# Altium project 1712.PrjPCB
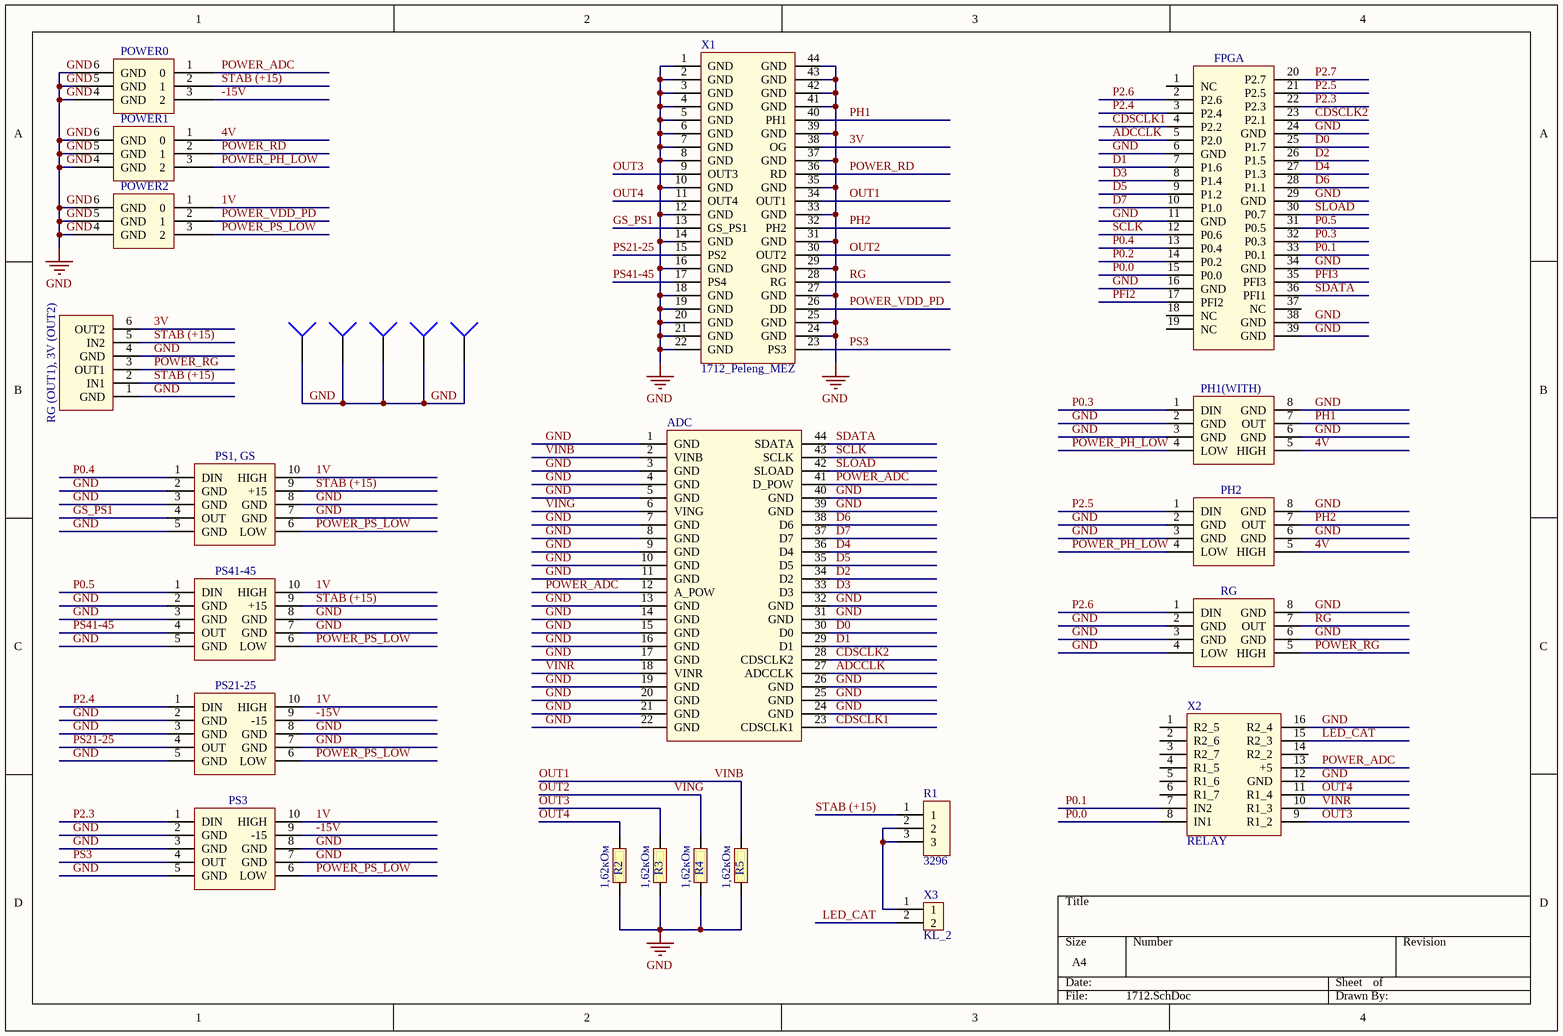
[diagram p0: 1712.SchDoc]
1 sheet, 26 parts. Net scope: global (net labels, ports and power ports of the same name join across sheets).
Board file: 1712_MB.PcbDoc

## Sheet 1712.SchDoc
size A4

### Parts
ADC  MEZON_ADC  [MEZON_ADC]  (value not drawn)
FPGA  CHEAP_CON_37_FEMALE  [CHEAP_CONN_FEMALE]  (value not drawn)
J1  Socket  [PIN1]  (value not drawn)
J2  Socket  [PIN1]  (value not drawn)
J3  Socket  [PIN1]  (value not drawn)
J4  Socket  [PIN1]  (value not drawn)
J5  Socket  [PIN1]  (value not drawn)
PH1(WITH)  MEZON_H  [MEZON_H]  (value not drawn)
PH2  MEZON_H  [MEZON_H]  (value not drawn)
POWER0  POWER  [POWER]  (value not drawn)
POWER1  POWER  [POWER]  (value not drawn)
POWER2  POWER  [POWER]  (value not drawn)
PS1,_GS  MEZON_V+15  [MEZON_V]  (value not drawn)
PS3  MEZON_V  [MEZON_V]  (value not drawn)
PS21-25  MEZON_V  [MEZON_V]  (value not drawn)
PS41-45  MEZON_V+15  [MEZON_V]  (value not drawn)
R1  3296  [PODSTR_RES_3296]
R2  1,62кОм  [RES]
R3  1,62кОм  [RES]
R4  1,62кОм  [RES]
R5  1,62кОм  [RES]
RG  MEZON_H  [MEZON_H]  (value not drawn)
RG_(OUT1),_3V_(OUT2)  MEZ_POWER  [MEZON_POWER_NEW]  (value not drawn)
X1  1712_Peleng_MEZ  [1712_Peleng_MEZ]
X2  RELAY  [RELAY_MODULE]
X3  KL_2  [KLEMMNIK_2]

### Nets
GND: ADC.1(GND) ADC.3(GND) ADC.4(GND) ADC.5(GND) ADC.7(GND) ADC.8(GND) ADC.9(GND) ADC.10(GND) ADC.11(GND) ADC.13(GND) ADC.14(GND) ADC.15(GND) ADC.16(GND) ADC.17(GND) ADC.19(GND) ADC.20(GND) ADC.21(GND) ADC.22(GND) ADC.24(GND) ADC.25(GND) ADC.26(GND) ADC.31(GND) ADC.32(GND) ADC.39(GND) ADC.40(GND) FPGA.6(GND) FPGA.11(GND) FPGA.16(GND) FPGA.24(GND) FPGA.29(GND) FPGA.34(GND) FPGA.38(GND) FPGA.39(GND) J1.1 J2.1 J3.1 J4.1 J5.1 PH1(WITH).2(GND) PH1(WITH).3(GND) PH1(WITH).6(GND) PH1(WITH).8(GND) PH2.2(GND) PH2.3(GND) PH2.6(GND) PH2.8(GND) POWER0.4(GND) POWER0.5(GND) POWER0.6(GND) POWER1.4(GND) POWER1.5(GND) POWER1.6(GND) POWER2.4(GND) POWER2.5(GND) POWER2.6(GND) PS1,_GS.2(GND) PS1,_GS.3(GND) PS1,_GS.5(GND) PS1,_GS.7(GND) PS1,_GS.8(GND) PS3.2(GND) PS3.3(GND) PS3.5(GND) PS3.7(GND) PS3.8(GND) PS21-25.2(GND) PS21-25.3(GND) PS21-25.5(GND) PS21-25.7(GND) PS21-25.8(GND) PS41-45.2(GND) PS41-45.3(GND) PS41-45.5(GND) PS41-45.7(GND) PS41-45.8(GND) R2.1 R3.1 R4.1 R5.1 RG.2(GND) RG.3(GND) RG.4(LOW) RG.6(GND) RG.8(GND) RG_(OUT1),_3V_(OUT2).1(GND) RG_(OUT1),_3V_(OUT2).4(GND) X1.1(GND) X1.2(GND) X1.3(GND) X1.4(GND) X1.5(GND) X1.6(GND) X1.7(GND) X1.8(GND) X1.10(GND) X1.12(GND) X1.14(GND) X1.16(GND) X1.18(GND) X1.19(GND) X1.20(GND) X1.21(GND) X1.22(GND) X1.24(GND) X1.25(GND) X1.27(GND) X1.29(GND) X1.31(GND) X1.33(GND) X1.35(GND) X1.37(GND) X1.39(GND) X1.41(GND) X1.42(GND) X1.43(GND) X1.44(GND) X2.12(GND) X2.16(R2_4)
1V: POWER2.1(0) PS1,_GS.10(HIGH) PS3.10(HIGH) PS21-25.10(HIGH) PS41-45.10(HIGH)
3V: RG_(OUT1),_3V_(OUT2).6(OUT2) X1.38(OG)
4V: PH1(WITH).5(HIGH) PH2.5(HIGH) POWER1.1(0)
-15V: POWER0.3(2) PS3.9(-15) PS21-25.9(-15)
ADCCLK: ADC.27(ADCCLK) FPGA.5(P2.0)
CDSCLK1: ADC.23(CDSCLK1) FPGA.4(P2.2)
CDSCLK2: ADC.28(CDSCLK2) FPGA.23(P2.1)
D0: ADC.30(D0) FPGA.25(P1.7)
D1: ADC.29(D1) FPGA.7(P1.6)
D2: ADC.34(D2) FPGA.26(P1.5)
D3: ADC.33(D3) FPGA.8(P1.4)
D4: ADC.36(D4) FPGA.27(P1.3)
D5: ADC.35(D5) FPGA.9(P1.2)
D6: ADC.38(D6) FPGA.28(P1.1)
D7: ADC.37(D7) FPGA.10(P1.0)
GS_PS1: PS1,_GS.4(OUT) X1.13(GS_PS1)
LED_CAT: X2.15(R2_3) X3.2
OUT1: ADC.2(VINB) R5.2 X1.34(OUT1)  [also labelled VINB]
OUT2: ADC.6(VING) R4.2 X1.30(OUT2)  [also labelled VING]
OUT3: R3.2 X1.9(OUT3) X2.9(R1_2)
OUT4: R2.2 X1.11(OUT4) X2.11(R1_4)
P0.0: FPGA.15(P0.0) X2.8(IN1)
P0.1: FPGA.33(P0.1) X2.7(IN2)
P0.2: FPGA.14(P0.2)
P0.3: FPGA.32(P0.3) PH1(WITH).1(DIN)
P0.4: FPGA.13(P0.4) PS1,_GS.1(DIN)
P0.5: FPGA.31(P0.5) PS41-45.1(DIN)
P2.3: FPGA.22(P2.3) PS3.1(DIN)
P2.4: FPGA.3(P2.4) PS21-25.1(DIN)
P2.5: FPGA.21(P2.5) PH2.1(DIN)
P2.6: FPGA.2(P2.6) RG.1(DIN)
P2.7: FPGA.20(P2.7)
PFI2: FPGA.17(PFI2)
PFI3: FPGA.35(PFI3)
PH1: PH1(WITH).7(OUT) X1.40(PH1)
PH2: PH2.7(OUT) X1.32(PH2)
POWER_ADC: ADC.12(A_POW) ADC.41(D_POW) POWER0.1(0) X2.13(+5)
POWER_PH_LOW: PH1(WITH).4(LOW) PH2.4(LOW) POWER1.3(2)
POWER_PS_LOW: POWER2.3(2) PS1,_GS.6(LOW) PS3.6(LOW) PS21-25.6(LOW) PS41-45.6(LOW)
POWER_RD: POWER1.2(1) X1.36(RD)
POWER_RG: RG.5(HIGH) RG_(OUT1),_3V_(OUT2).3(OUT1)
POWER_VDD_PD: POWER2.2(1) X1.26(DD)
PS3: PS3.4(OUT) X1.23(PS3)
PS21-25: PS21-25.4(OUT) X1.15(PS2)
PS41-45: PS41-45.4(OUT) X1.17(PS4)
RG: RG.7(OUT) X1.28(RG)
SCLK: ADC.43(SCLK) FPGA.12(P0.6)
SDATA: ADC.44(SDATA) FPGA.36(PFI1)
SLOAD: ADC.42(SLOAD) FPGA.30(P0.7)
STAB (+15): POWER0.2(1) PS1,_GS.9(+15) PS41-45.9(+15) R1.1 RG_(OUT1),_3V_(OUT2).2(IN1) RG_(OUT1),_3V_(OUT2).5(IN2)
VINR: ADC.18(VINR) X2.10(R1_3)
NetR1_2: R1.2 R1.3 X3.1

Not connected (* = marked no-connect by the designer): FPGA 1(NC) 18(NC) 19(NC) 37(NC); X2 1(R2_5) 2(R2_6) 3(R2_7) 4(R1_5) 5(R1_6) 6(R1_7) 14(R2_2)

### Library data of the parts
PS1,_GS PS41-45 = MEZON_V_+15
R1 = PODSTR_RES_NEW
R2-R5 = RES
RG_(OUT1),_3V_(OUT2) = MEZON_POWER_NEW
X2 = MEZON_RELAY
X3 = KLEMMNIK_2
J1-J5 = Socket: LatestRevisionDate: 17-Jul-2002; LatestRevisionNote: Re-released for DXP Platform.; Publisher: Altium Limited